# EAGLE design mbc_82_21_03_01 (EAGLE 7.6.0)

## Sheet 1 of 2
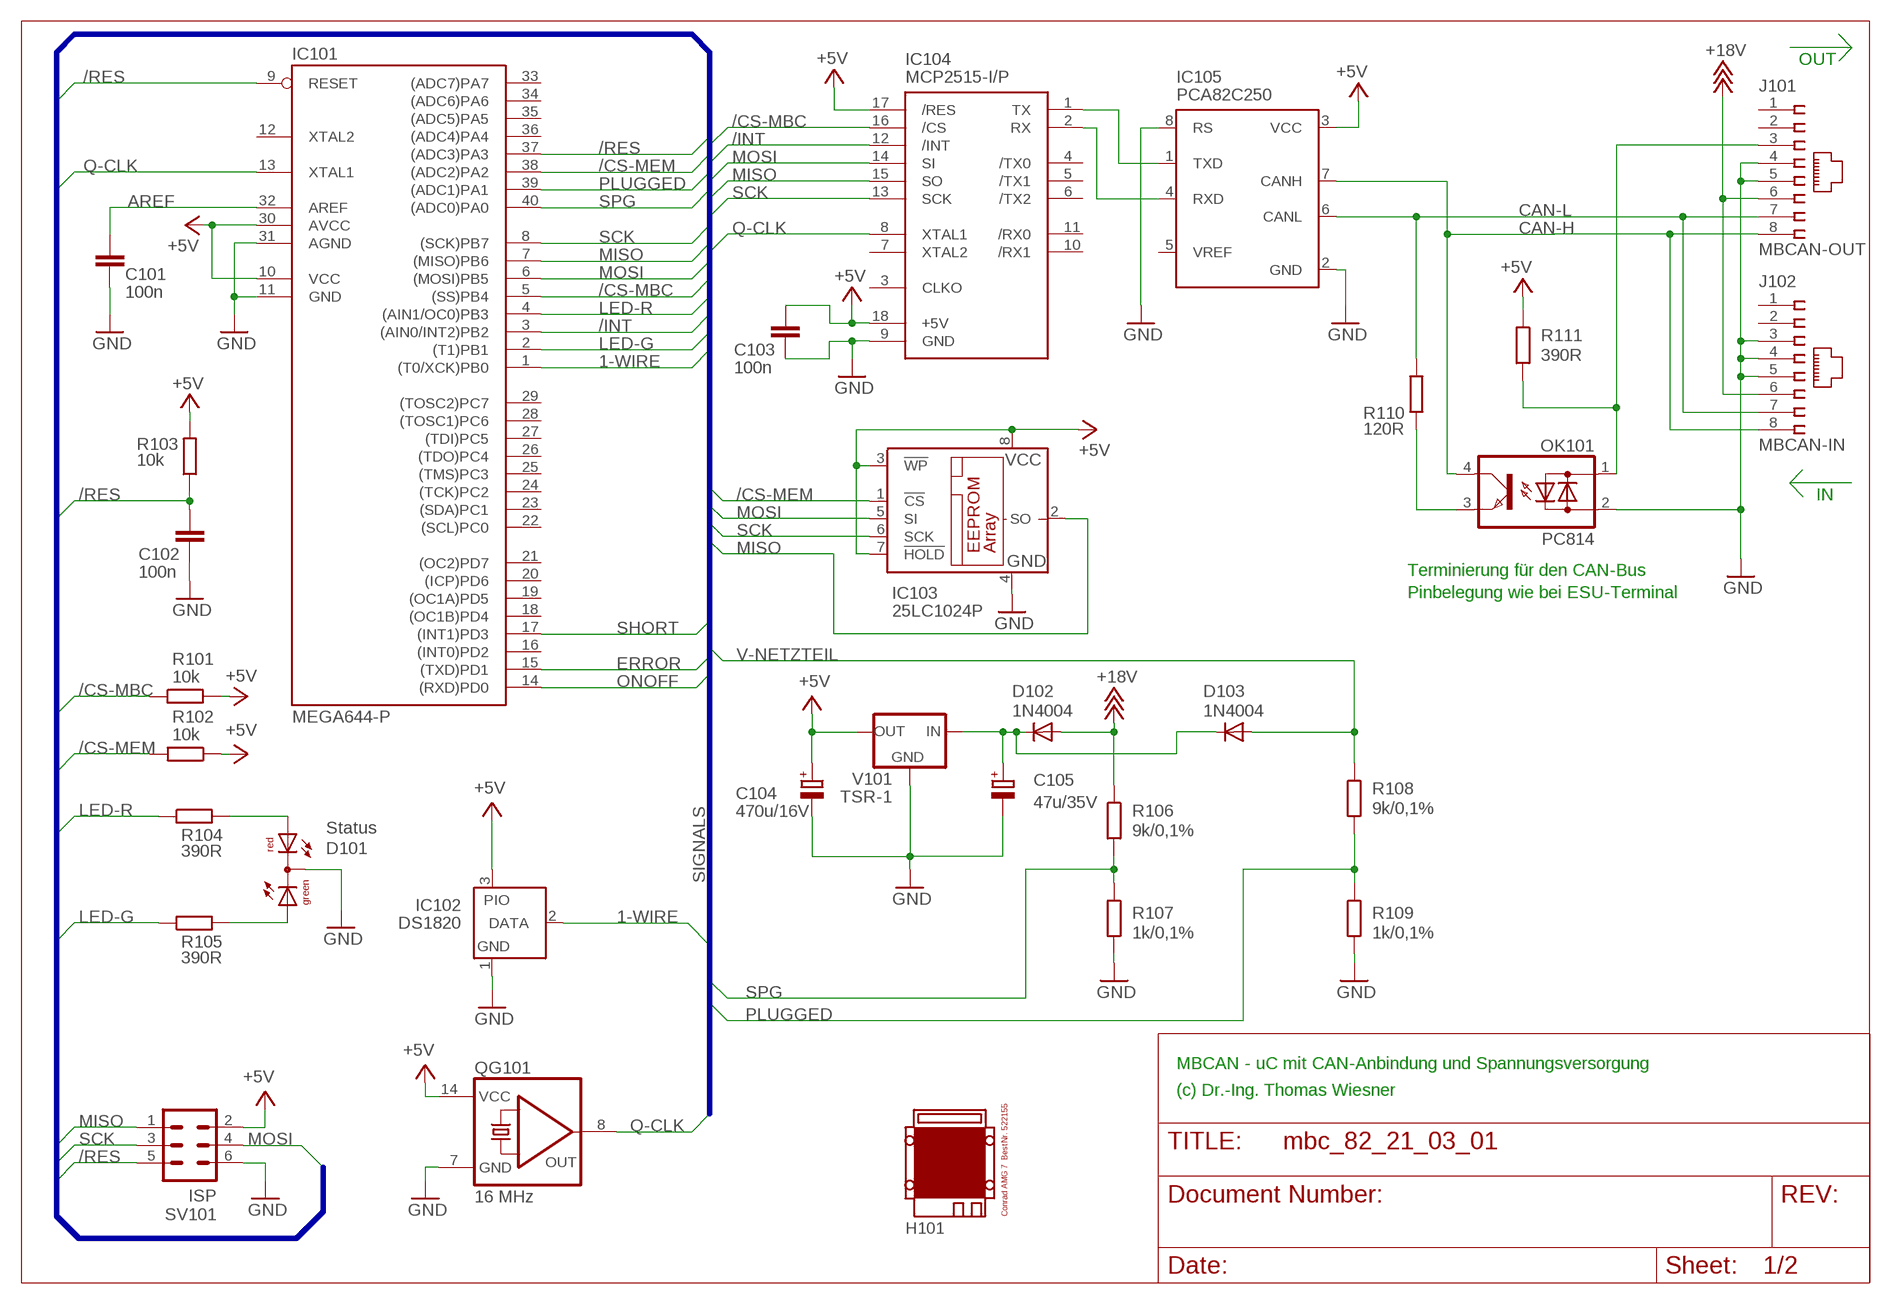
[diagram p0: schematic, sheet 1]

### Parts
C101  100n  C-EU025-025X050  [C025-025X050]
C102  100n  C-EU025-025X050  [C025-025X050]
C103  100n  C-EU025-025X050  [C025-025X050]
C104  470u/16V  CPOL-EUE3.5-8  [E3,5-8]
C105  47u/35V  CPOL-EUE2.5-7  [E2,5-7]
D101  Status  DUOLED5MM  [DUOLED5MM]
D102  1N4004  [DO41-10]
D103  1N4004  [DO41-10]
H101  MODULGEHÄUSE-AMG-7  [MODULGEHÄUSE-AMG-7]
IC101  MEGA644-P  MEGA323-P  [DIL40]
IC102  DS1820  DS2405  [TO92-]
IC103  25LC1024P  25LC040P  [DIL8]
IC104  MCP2515-I/P  MCP2510-I/P  [DIL18]
IC105  PCA82C250  [DIL08]
J101  MBCAN-OUT  215877-4  [215877-4]
J102  MBCAN-IN  215877-4  [215877-4]
OK101  PC814  [DIL04]
QG101  16 MHz  QG5860  [DIL14S]
R101  10k  R-EU_0207/10  [0207/10]
R102  10k  R-EU_0207/10  [0207/10]
R103  10k  R-EU_0207/10  [0207/10]
R104  390R  R-EU_0207/10  [0207/10]
R105  390R  R-EU_0207/10  [0207/10]
R106  9k/0,1%  R-EU_0207/10  [0207/10]
R107  1k/0,1%  R-EU_0207/10  [0207/10]
R108  9k/0,1%  R-EU_0207/10  [0207/10]
R109  1k/0,1%  R-EU_0207/10  [0207/10]
R110  120R  R-EU_0207/10  [0207/10]
R111  390R  R-EU_0207/10  [0207/10]
SV101  ISP  ML6  [ML6]
V101  TSR-1  [TRACO-TSR-1]

### Nets
1-WIRE: IC101.1((T0/XCK)PB0) IC102.2(DATA)
+5V: C103.1 C104.+ IC101.10(VCC) IC101.30(AVCC) IC102.3(PIO) IC103.3(!WP) IC103.7(!HOLD) IC103.8(VCC) IC104.17(/RES) IC104.18(+5V) IC105.3(VCC) QG101.14(VCC) R101.2 R102.1 R103.2 R111.1 SV101.2 V101.OUT ; also sheet 2
+18V: D102.A J101.6 J102.6 R106.1
/CS-MBC: IC101.5((SS)PB4) IC104.16(/CS) R101.1
/CS-MEM: IC101.38((ADC2)PA2) IC103.1(!CS) R102.2
/INT: IC101.3((AIN0/INT2)PB2) IC104.12(/INT)
/RES: C102.1 IC101.9(RESET) IC101.37((ADC3)PA3) R103.1 SV101.5
AREF: C101.1 IC101.32(AREF)
CAN-H: IC105.7(CANH) J101.8 J102.8 OK101.4(C)
CAN-L: IC105.6(CANL) J101.7 J102.7 R110.2
ERROR: IC101.15((TXD)PD1) ; also sheet 2
GND: C101.2 C102.2 C103.2 C104.- C105.- D101.K(C) IC101.11(GND) IC101.31(AGND) IC102.1(GND) IC103.4(GND) IC104.9(GND) IC105.2(GND) IC105.8(RS) J101.4 J101.5 J102.3 J102.4 J102.5 OK101.2(AC2) QG101.7(GND) R107.2 R109.2 SV101.6 V101.GND ; also sheet 2
LED-G: IC101.2((T1)PB1) R105.1
LED-R: IC101.4((AIN1/OC0)PB3) R104.1
MISO: IC101.7((MISO)PB6) IC103.2(SO) IC104.15(SO) SV101.1
MOSI: IC101.6((MOSI)PB5) IC103.5(SI) IC104.14(SI) SV101.4
N$1: IC104.1(TX) IC105.1(TXD)
N$2: IC104.2(RX) IC105.4(RXD)
N$3: OK101.3(E) R110.1
N$4: J101.3 OK101.1(AC1) R111.2
N$6: C105.+ D102.C D103.C V101.IN
N$9: D101.AR R104.2
N$13: D101.AG R105.2
ONOFF: IC101.14((RXD)PD0) ; also sheet 2
PLUGGED: IC101.39((ADC1)PA1) R108.2 R109.1
Q-CLK: IC101.13(XTAL1) IC104.8(XTAL1) QG101.8(OUT)
SCK: IC101.8((SCK)PB7) IC103.6(SCK) IC104.13(SCK) SV101.3
SHORT: IC101.17((INT1)PD3) ; also sheet 2
SPG: IC101.40((ADC0)PA0) R106.2 R107.1
V-NETZTEIL: D103.A R108.1 ; also sheet 2
Unconnected: IC101.12(XTAL2) IC101.16((INT0)PD2) IC101.18((OC1B)PD4) IC101.19((OC1A)PD5) IC101.20((ICP)PD6) IC101.21((OC2)PD7) IC101.22((SCL)PC0) IC101.23((SDA)PC1) IC101.24((TCK)PC2) IC101.25((TMS)PC3) IC101.26((TDO)PC4) IC101.27((TDI)PC5) IC101.28((TOSC1)PC6) IC101.29((TOSC2)PC7) IC101.33((ADC7)PA7) IC101.34((ADC6)PA6) IC101.35((ADC5)PA5) IC101.36((ADC4)PA4) IC104.3(CLKO) IC104.4(/TX0) IC104.5(/TX1) IC104.6(/TX2) IC104.7(XTAL2) IC104.10(/RX1) IC104.11(/RX0) IC105.5(VREF) J101.1 J101.2 J102.1 J102.2

### Buses
SIGNALS

### Notes on the sheet
- OUT
- IN
- Terminierung für den CAN-Bus
- Pinbelegung wie bei ESU-Terminal
- MBCAN - uC mit CAN-Anbindung und Spannungsversorgung
- (c) Dr.-Ing. Thomas Wiesner

## Sheet 2 of 2
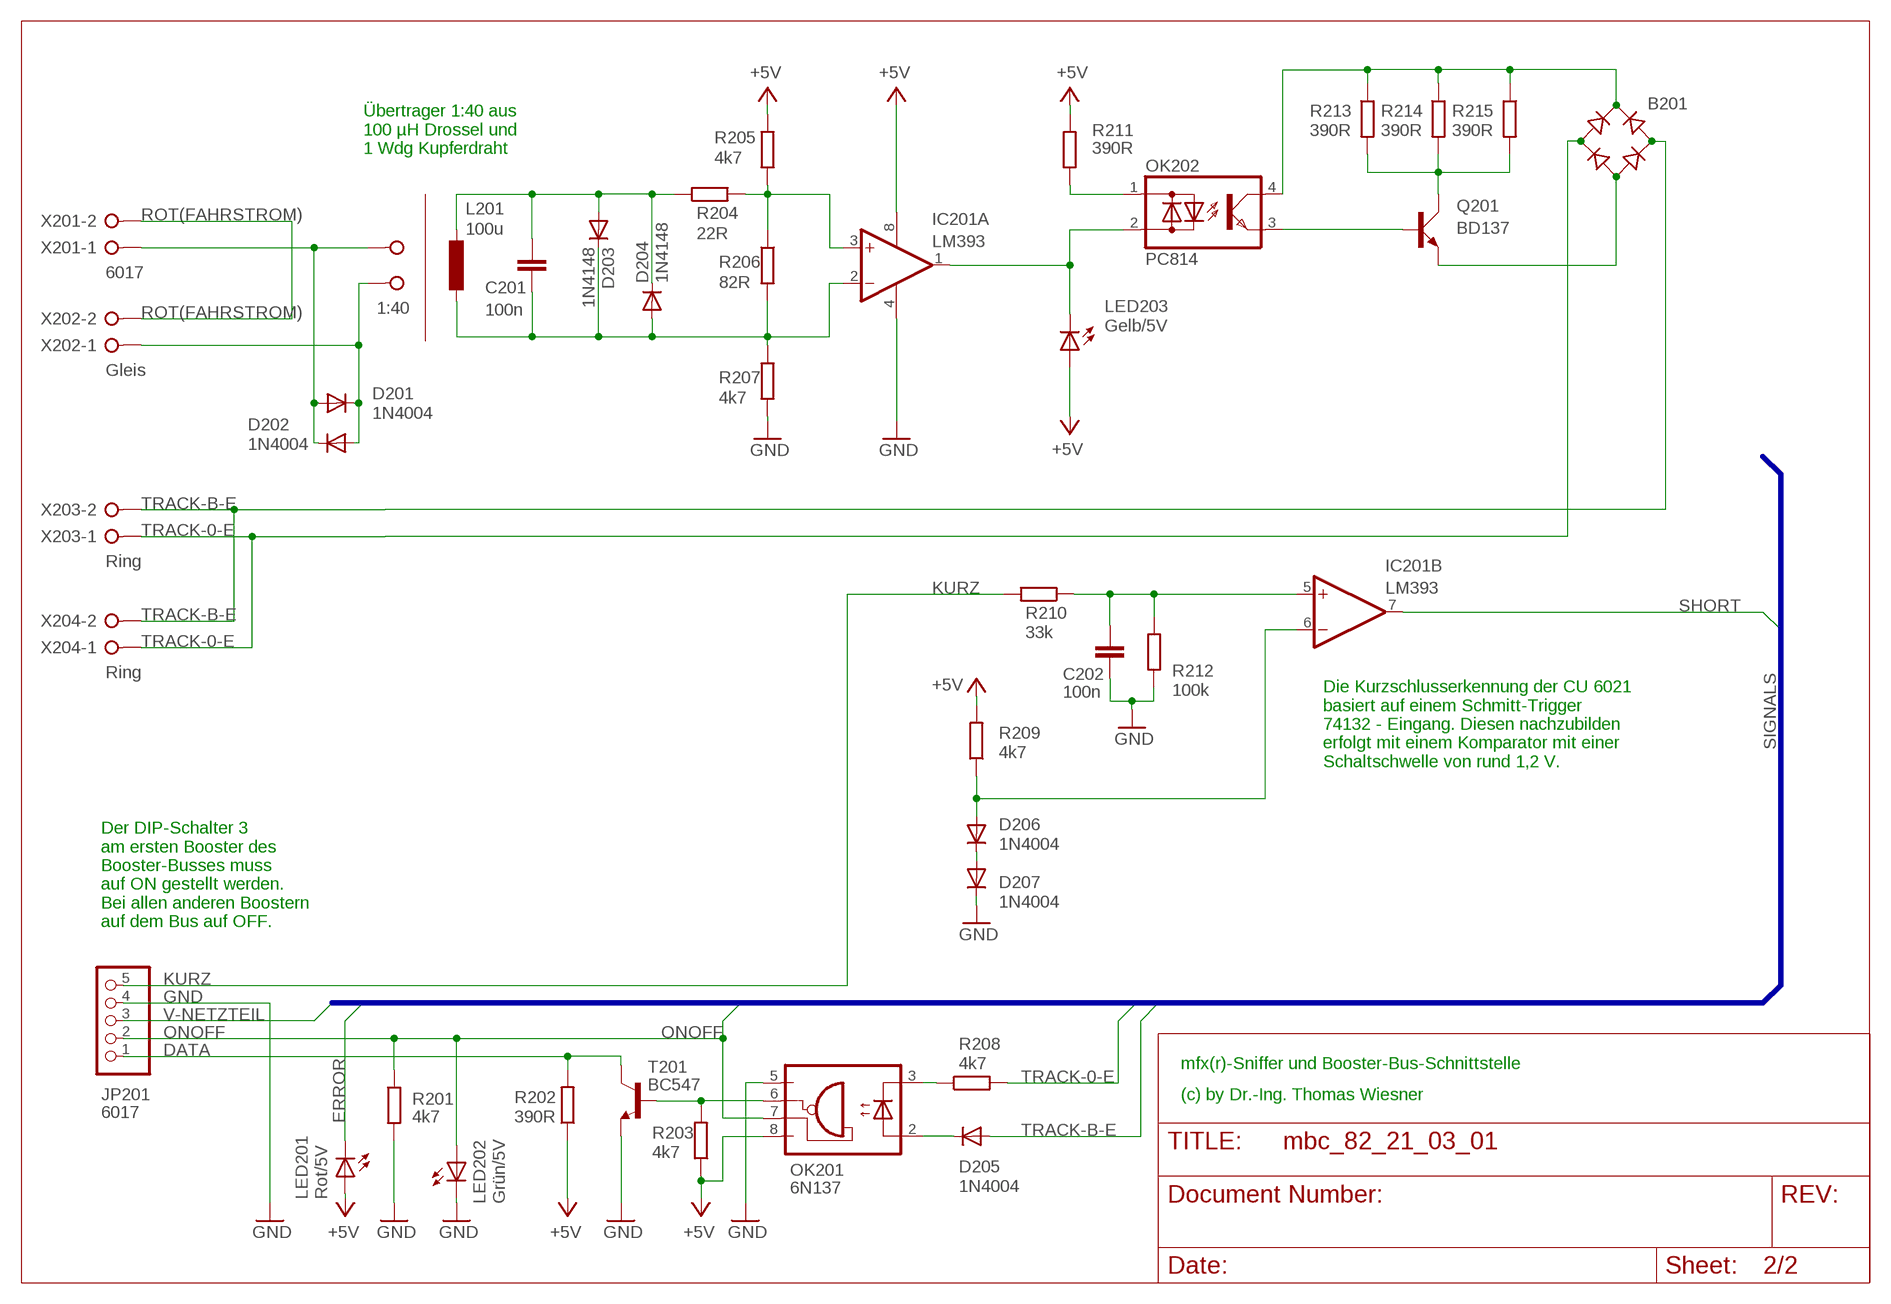
[diagram p1: schematic, sheet 2]

### Parts
B201  RB1A  [RB1A]
C201  100n  C-EU025-025X050  [C025-025X050]
C202  100n  C-EU025-025X050  [C025-025X050]
D201  1N4004  [DO41-10]
D202  1N4004  [DO41-10]
D203  1N4148  1N4148DO35-10  [DO35-10]
D204  1N4148  1N4148DO35-10  [DO35-10]
D205  1N4004  [DO41-10]
D206  1N4004  [DO41-10]
D207  1N4004  [DO41-10]
IC201  LM393  [DIL08]
JP201  6017  PINHD-1X5  [1X05]
L201  100u  L-EU6000-XXX-RC  [6000-XXXX-RC]
LED201  Rot/5V  LED3MM  [LED3MM]
LED202  Grün/5V  LED3MM  [LED3MM]
LED203  Gelb/5V  LED3MM  [LED3MM]
OK201  6N137  [DIL08]
OK202  PC814  [DIL04]
Q201  BD137  BD139  [TO126AV]
R201  4k7  R-EU_0207/10  [0207/10]
R202  390R  R-EU_0207/10  [0207/10]
R203  4k7  R-EU_0207/10  [0207/10]
R204  22R  R-EU_0207/10  [0207/10]
R205  4k7  R-EU_0207/10  [0207/10]
R206  82R  R-EU_0207/10  [0207/10]
R207  4k7  R-EU_0207/10  [0207/10]
R208  4k7  R-EU_0207/10  [0207/10]
R209  4k7  R-EU_0207/10  [0207/10]
R210  33k  R-EU_0207/10  [0207/10]
R211  390R  R-EU_0207/10  [0207/10]
R212  100k  R-EU_0207/10  [0207/10]
R213  390R  R-EU_0207/10  [0207/10]
R214  390R  R-EU_0207/10  [0207/10]
R215  390R  R-EU_0207/10  [0207/10]
T201  BC547  [TO92]
TP  1:40  W237-02P  [W237-132]
X201  6017  W237-02P  [W237-132]
X202  Gleis  W237-02P  [W237-132]
X203  Ring  W237-02P  [W237-132]
X204  Ring  W237-02P  [W237-132]

### Nets
+5V: IC201.8(A:V+) LED201.A LED203.A OK201.8(VCC) R202.1 R203.1 R205.2 R209.2 R211.2 ; also sheet 1
DATA: JP201.1 R202.2 T201.3(C)
ERROR: LED201.K(C) ; also sheet 1
GND: C202.2 D207.C IC201.4(A:V-) JP201.4 LED202.K(C) OK201.5(GND) R201.2 R207.2 R212.2 T201.1(E) ; also sheet 1
KURZ: JP201.5 R210.2
N$5: OK202.3(E) Q201.B
N$7: D205.C OK201.2(A)
N$8: OK201.3(C) R208.1
N$12: B201.- Q201.E
N$14: C201.2 D203.C D204.A IC201.2(A:-IN) L201.2 R206.2 R207.1
N$15: IC201.3(A:+IN) R204.2 R205.1 R206.1
N$16: D201.C D202.A TP.1 X202.1
N$17: B201.+ OK202.4(C) R213.1 R214.1 R215.1
N$18: Q201.C R213.2 R214.2 R215.2
N$19: C201.1 D203.A D204.C L201.1 R204.1
N$20: D206.C D207.A
N$21: OK202.1(AC1) R211.1
N$22: IC201.1(A:COLOUT) LED203.K(C) OK202.2(AC2)
N$23: D206.A IC201.6(B:-IN) R209.1
N$24: C202.1 IC201.5(B:+IN) R210.1 R212.1
N$29: OK201.6(VO) R203.2 T201.2(B)
O': D201.A D202.C TP.2 X201.1
ONOFF: JP201.2 LED202.A OK201.7(VE) R201.1 ; also sheet 1
ROT(FAHRSTROM): X201.2 X202.2
SHORT: IC201.7(B:COLOUT) ; also sheet 1
TRACK-0-E: B201.AC1 R208.2 X203.1 X204.1
TRACK-B-E: B201.AC2 D205.A X203.2 X204.2
V-NETZTEIL: JP201.3 ; also sheet 1

### Buses
SIGNALS

### Notes on the sheet
- Übertrager 1:40 aus
  100 µH Drossel und 
  1 Wdg Kupferdraht
- Die Kurzschlusserkennung der CU 6021
  basiert auf einem Schmitt-Trigger 
  74132 - Eingang. Diesen nachzubilden 
  erfolgt mit einem Komparator mit einer
  Schaltschwelle von rund 1,2 V.
- Der DIP-Schalter 3
  am ersten Booster des
  Booster-Busses muss
  auf ON gestellt werden.
  Bei allen anderen Boostern
  auf dem Bus auf OFF.
- mfx(r)-Sniffer und Booster-Bus-Schnittstelle
- (c) by Dr.-Ing. Thomas Wiesner

## Library data of the parts
B201 = rectifier:RB1A: RECTIFIER 1 A
C101-C103 C201 C202 = rcl:C-EU: CAPACITOR, European symbol
C104 C105 = rcl:CPOL-EU: POLARIZED CAPACITOR, European symbol
D101 = led:DUOLED5MM: DUO LED 2 colors, 5 mm, round
D102 D103 D201 D202 D205-D207 = diode:1N4004: DIODE general purpose rectifier, 1 A
D203 D204 = diode:1N4148: DIODE high speed (Philips)
H101 = mbc:MODULGEHÄUSE-AMG-7: Gehäuse Conrad AMG 7 BestNr. 522155
IC101 = atmel:MEGA323-P: MICROCONTROLLER 32 Kbytes FLASH 2 Kbytes SRAM 1 Kbytes EEPROM USART 8-channel 10 bit ADC Source: avr.lbr; OC_FARNELL: unknown; OC_NEWARK: unknown
IC102 = maxim:DS2405: Addressable Switch DALLAS Semiconductor; MF: DALLAS SEMICONDUCTOR; MPN: DS2405; OC_FARNELL: 1188025; OC_NEWARK: 06F4645
IC103 = microchip:25*: Serial EEPROM 4K/ 8K , SPI bus; MF: MICROCHIP; MPN: 25LC040/P; OC_FARNELL: 9758100; OC_NEWARK: 96K4091
IC104 = mbc:MCP2510: BASIC-CAN 2.0a Controller Stand-alone CAN controller von Microchip
IC105 = micro-philips:PCA82C250: CAN CONTROLLER INTERFACE; OC_FARNELL: 3692358; OC_NEWARK: unknown
IC201 = mbc:LM393: DC-Comparator Dual
J101 J102 = con-amp:215877-4: AMP connector
JP201 = pinhead:PINHD-1X5: PIN HEADER
L201 = rcl:L-EU: INDUCTOR, European symbol
LED201-LED203 = led:LED: LED OSRAM: - CHIPLED LG R971, LG N971, LY N971, LG Q971, LY Q971, LO R971, LY R971 LH N974, LH R974 LS Q976, LO Q976, LY Q976 LO Q996 - Hyper CHIPLED LW Q18S LB Q993, LB Q99A, LB R99A - SideLED LS A670, LO A670, LY A670, LG A670, LP A670 LB A673, LV A673, LT A673, LW A673 LH A674 LY A675 LS A676, LA A676, LO A676, LY A676, LW A676 LS A679, LY A679, LG A679 - Hyper Micro SIDELED® LS Y876, LA Y876, LO Y876, LY Y876 LT Y87S - SmartLED LW L88C, LW L88S LB L89C, LB L89S, LG L890 LS L89K, LO L89K, LY L89K LS L896, LA L896, LO L896, LY L896 - TOPLED LS T670, LO T670, LY T670, LG T670, LP T670 LSG T670, LSP T670, LSY T670, LOP T670, LYG T670 LG T671, LOG T671, LSG T671 LB T673, LV T673, LT T673, LW T673 LH T674 LS T676, LA T676, LO T676, LY T676, LB T676, LH T676, LSB T676, LW T676 LB T67C, LV T67C, LT T67C, LS T67K, LO T67K, LY T67K, LW E67C LS E67B, LA E67B, LO E67B, LY E67B, LB E67C, LV E67C, LT E67C LW T67C LS T679, LY T679, LG T679 LS T770, LO T770, LY T770, LG T770, LP T770 LB T773, LV T773, LT T773, LW T773 LH T774 LS E675, LA E675, LY E675, LS T675 LS T776, LA T776, LO T776, LY T776, LB T776 LHGB T686 LT T68C, LB T68C - Hyper Mini TOPLED® LB M676 - Mini TOPLED Santana® LG M470 LS M47K, LO M47K, LY M47K Source: http://www.osram.convergy.de LUXEON: - LUMILED® LXK2-PW12-R00, LXK2-PW12-S00, LXK2-PW14-U00, LXK2-PW14-V00 LXK2-PM12-R00, LXK2-PM12-S00, LXK2-PM14-U00 LXK2-PE12-Q00, LXK2-PE12-R00, LXK2-PE12-S00, LXK2-PE14-T00, LXK2-PE14-U00 LXK2-PB12-K00, LXK2-PB12-L00, LXK2-PB12-M00, LXK2-PB14-N00, LXK2-PB14-P00, LXK2-PB14-Q00 LXK2-PR12-L00, LXK2-PR12-M00, LXK2-PR14-Q00, LXK2-PR14-R00 LXK2-PD12-Q00, LXK2-PD12-R00, LXK2-PD12-S00 LXK2-PH12-R00, LXK2-PH12-S00 LXK2-PL12-P00, LXK2-PL12-Q00, LXK2-PL12-R00 Source: www.luxeon.com KINGBRIGHT: KA-3528ASYC Source: www.kingbright.com
OK101 OK202 = optocoupler:PC814: SHARP OPTO COUPLER; OC_FARNELL: 9707662; OC_NEWARK: unknown
OK201 = optocoupler:6N137: MOTOROLA OPTO COUPLER; MPN: 6N137; OC_FARNELL: 1328376; OC_NEWARK: 52M1895
Q201 = transistor-power:BD139: NPN TRANSISTOR
QG101 = crystal:QG5860: CRYSTAL RESONATOR; OC_FARNELL: unknown; OC_NEWARK: unknown
R101-R111 R201-R215 = resistor:R-EU_: RESISTOR, European symbol
SV101 = con-ml:ML6: HARTING; OC_FARNELL: unknown; OC_NEWARK: unknown
T201 = transistor:BC547: NPN TRANSISTOR
TP X201-X204 = con-wago-508:W237-02P: WAGO SREW CLAMP; OC_FARNELL: unknown; OC_NEWARK: unknown
V101 = mbc:TSR-1: Spannungsregler Hersteller: TRACO Typ: TSR-1 5V: TSR 1-2450 Spg: 5V Strom: 1A Reichelt TSR 1-2450

## Board
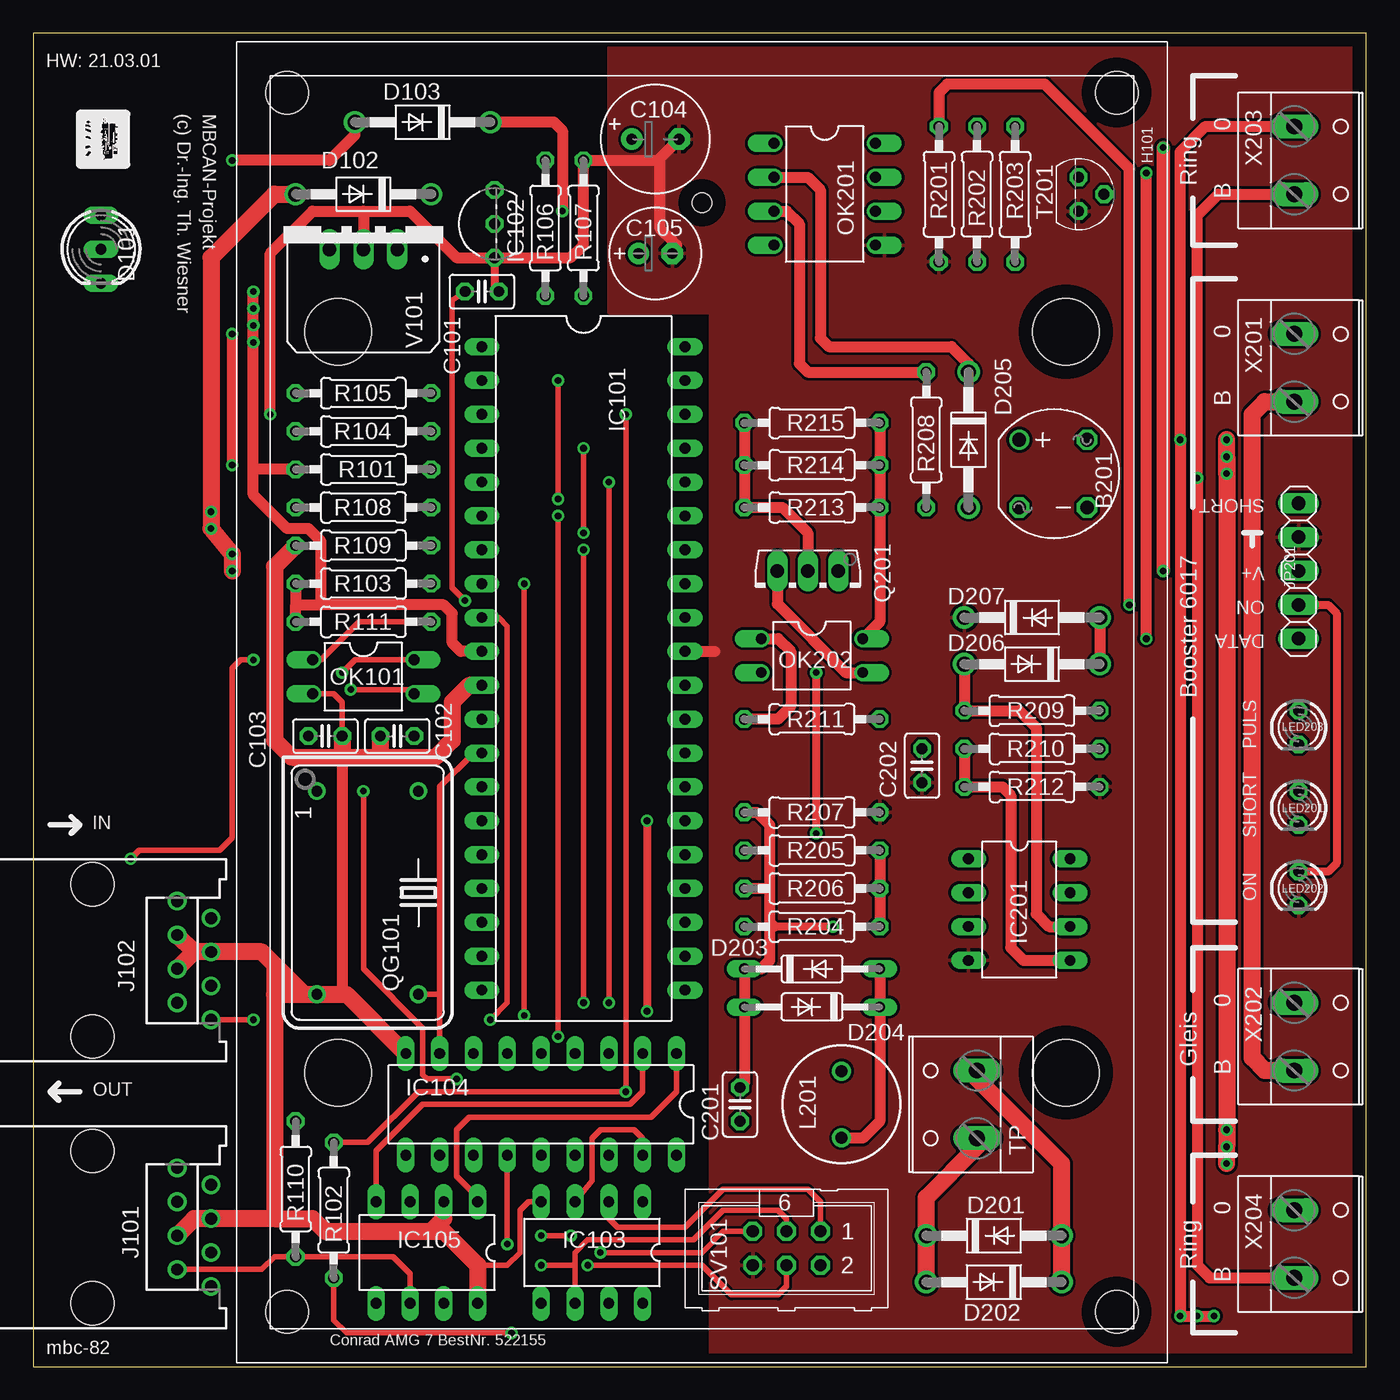
[diagram p2: board, top side]
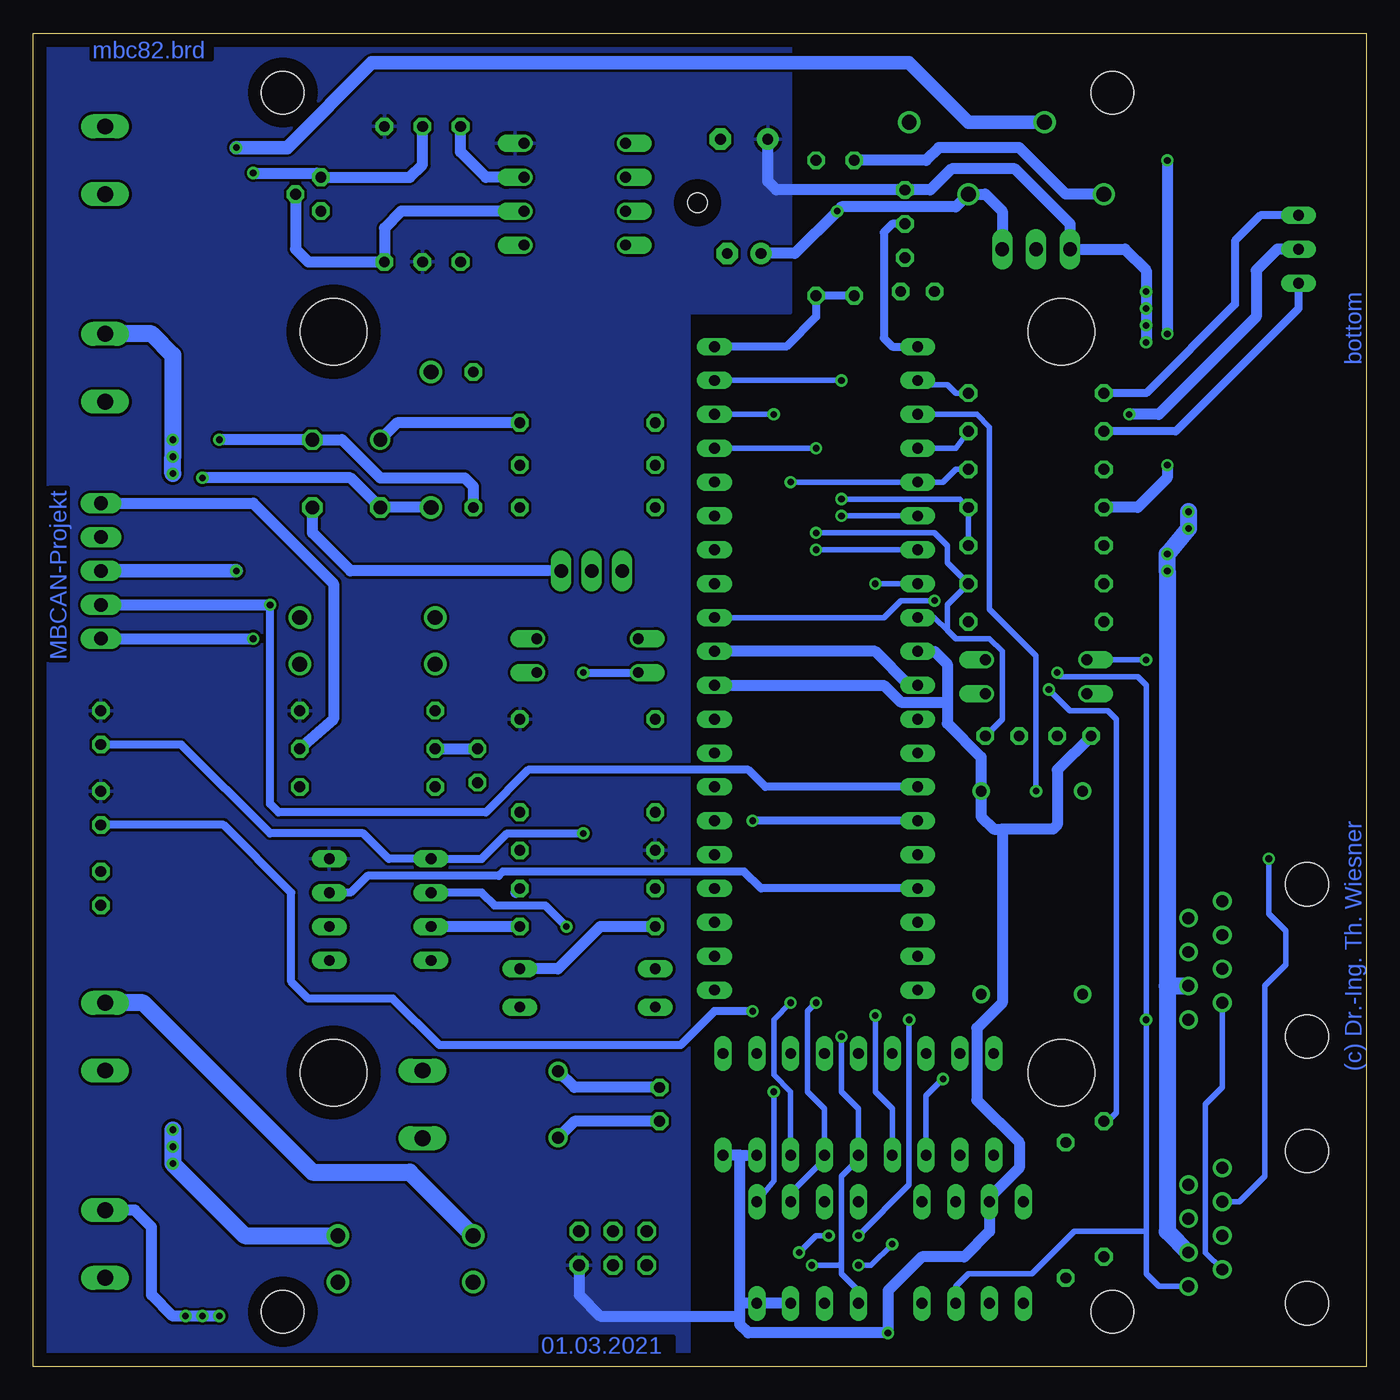
[diagram p3: board, bottom side, seen from below]

Size 100 x 99.99 mm. Coordinates in mm from the lower left corner, seen from the top.
Outline: 0,99.99 0,0 100,0 100,99.99 0,99.99
Copper layers (1*16): Top 0.035mm / dielectric 1.5mm / Bottom 0.035mm
Design rules "default *": minimum track width 10mil, minimum drill 0.5mm, track to track 8mil, track to pad 8mil, pad to pad 8mil, via to via 8mil, smd to smd 8mil, copper to edge 40mil, drill to drill 8mil, minimum pad ring 10mil, minimum via ring 8mil, stop-mask expansion 4mil, vias tented up to drill 0mil, thermal gap 10mil

### Footprints (pad centres in the part's own frame; a part is rotated, then mirrored left to right if it is on the bottom)
RB1A = drill 1.016: + -2.54,2.54 | drill 1.016 octagon: - 2.54,-2.54; AC1 2.54,2.54; AC2 -2.54,-2.54
C025-025X050 = drill 0.813 octagon: 1 -1.27,0; 2 1.27,0
E3,5-8 = drill 0.813 pad 1.6: + -1.778,0 | drill 0.813 pad 1.6 octagon: - 1.778,0
E2,5-7 = drill 0.813 pad 1.6: + -1.27,0 | drill 0.813 pad 1.6 octagon: - 1.27,0
DUOLED5MM = drill 0.813 long: AG -2.54,0; AR 2.54,0; K 0,0
DO41-10 = drill 1.118: A 5.08,0; C -5.08,0
DO35-10 = drill 0.813 long: A 5.08,0; C -5.08,0
MODULGEHÄUSE-AMG-7 = hole 3.2: -45.72,-31.115; -45.72,31.115; 45.72,31.115; 45.72,-31.115 | hole 5: -27.781,-27.305; 27.781,-27.305; -27.781,27.305; 27.781,27.305 | hole 1.5: -37.465,0
DIL40 = drill 0.813 long: 1 -24.13,-7.62; 2 -21.59,-7.62; 3 -19.05,-7.62; 4 -16.51,-7.62; 5 -13.97,-7.62; 6 -11.43,-7.62; 7 -8.89,-7.62; 8 -6.35,-7.62; 9 -3.81,-7.62; 10 -1.27,-7.62; 11 1.27,-7.62; 12 3.81,-7.62; 13 6.35,-7.62; 14 8.89,-7.62; 15 11.43,-7.62; 16 13.97,-7.62; 17 16.51,-7.62; 18 19.05,-7.62; 19 21.59,-7.62; 20 24.13,-7.62; 21 24.13,7.62; 22 21.59,7.62; 23 19.05,7.62; 24 16.51,7.62; 25 13.97,7.62; 26 11.43,7.62; 27 8.89,7.62; 28 6.35,7.62; 29 3.81,7.62; 30 1.27,7.62; 31 -1.27,7.62; 32 -3.81,7.62; 33 -6.35,7.62; 34 -8.89,7.62; 35 -11.43,7.62; 36 -13.97,7.62; 37 -16.51,7.62; 38 -19.05,7.62; 39 -21.59,7.62; 40 -24.13,7.62
TO92- = drill 0.813 octagon: 1 -2.54,0; 2 0,0; 3 2.54,0
DIL8 = drill 0.813 long: 1 -3.81,-3.81; 2 -1.27,-3.81; 3 1.27,-3.81; 4 3.81,-3.81; 5 3.81,3.81; 6 1.27,3.81; 7 -1.27,3.81; 8 -3.81,3.81
DIL18 = drill 0.813 long: 1 -10.16,-3.81; 2 -7.62,-3.81; 3 -5.08,-3.81; 4 -2.54,-3.81 | drill 0.8 long: 5 0,-3.81; 6 2.54,-3.81; 7 5.08,-3.81; 8 7.62,-3.81; 9 10.16,-3.81; 10 10.16,3.81; 11 7.62,3.81; 12 5.08,3.81; 13 2.54,3.81; 14 0,3.81; 15 -2.54,3.81; 16 -5.08,3.81; 17 -7.62,3.81; 18 -10.16,3.81
DIL08 = drill 0.813 long: 1 -3.81,-3.81; 2 -1.27,-3.81; 3 1.27,-3.81; 4 3.81,-3.81; 5 3.81,3.81; 6 1.27,3.81; 7 -1.27,3.81; 8 -3.81,3.81
215877-4 = drill 0.889: 1 -4.445,6.35; 2 -3.175,8.89; 3 -1.905,6.35; 4 -0.635,8.89; 5 0.635,6.35; 6 1.905,8.89; 7 3.175,6.35; 8 4.445,8.89 | hole 3.251: -5.715,0; 5.715,0
1X05 = drill 1.016 long: 1 -5.08,0; 2 -2.54,0; 3 0,0; 4 2.54,0; 5 5.08,0
6000-XXXX-RC = drill 0.9 pad 1.422: 1 -2.5,0; 2 2.5,0
LED3MM = drill 0.813 octagon: A -1.27,0; K 1.27,0
DIL04 = drill 0.813 offset: 1 -1.27,-3.81; 2 1.27,-3.81; 3 1.27,3.81; 4 -1.27,3.81
DIL08' = drill 0.813 offset: 1 -3.81,-3.81; 2 -1.27,-3.81; 3 1.27,-3.81; 4 3.81,-3.81; 5 3.81,3.81; 6 1.27,3.81; 7 -1.27,3.81; 8 -3.81,3.81
TO126AV = drill 1.016 long: B 2.286,-1.27; C 0,-1.27; E -2.286,-1.27
DIL14S = drill 0.813: 1 -7.62,-3.81; 7 7.62,-3.81; 8 7.62,3.81; 14 -7.62,3.81
0207/10 = drill 0.813 octagon: 1 -5.08,0; 2 5.08,0
ML6 = drill 0.914 octagon: 1 -2.54,-1.27; 2 -2.54,1.27; 3 0,-1.27; 4 0,1.27; 5 2.54,-1.27; 6 2.54,1.27
TO92 = drill 0.813 octagon: 1 1.27,0; 2 0,1.905; 3 -1.27,0
W237-132 = drill 1.194 long: 1 -2.54,-0.635; 2 2.54,-0.635
TRACO-TSR-1 = drill 1.016 long: GND 0,2.54; IN -2.54,2.54; OUT 2.54,2.54

### Placement (x,y rotation side)
B201  76.52,66.97 0 top
C101  33.66,80.62 0 top
C102  27.3,47.29 180 top
C103  21.91,47.29 0 top
C104  46.67,92.06 0 top
C105  46.67,83.48 0 top
C201  53.02,19.66 90 top
C202  66.67,45.06 270 top
D101  5.08,83.8 270 top
D102  24.77,87.93 180 top
D103  29.21,93.33 180 top
D201  72.07,9.82 0 top
D202  72.07,6.33 180 top
D203  58.42,29.82 0 top
D204  58.42,26.97 180 top
D205  70.17,69.51 270 top
D206  74.93,52.68 180 top
D207  74.93,56.18 0 top
H101  50.16,49.83 270 top
IC101  41.27,52.37 270 top
IC102  34.61,85.7 90 top
IC103  41.91,8.55 180 top
IC104  38.1,19.66 180 top
IC105  29.53,8.55 180 top
IC201  73.98,34.27 270 top
J101  4.45,10.46 270 top
J102  4.45,30.46 270 top
JP201  94.93,59.67 90 top
L201  60.64,19.66 90 top
LED201  94.93,41.89 270 top
LED202  94.93,35.86 270 top
LED203  94.93,47.92 270 top
OK101  24.77,51.73 270 top
OK201  6N137  [DIL08']  59.37,87.93 270 top
OK202  58.42,53.32 270 top
Q201  58.1,58.4 180 top
QG101  25.08,35.54 270 top
R101  24.77,67.29 180 top
R102  22.54,11.73 90 top
R103  24.77,58.72 180 top
R104  24.77,70.15 180 top
R105  24.77,73.01 180 top
R106  38.42,85.39 270 top
R107  41.27,85.39 90 top
R108  24.77,64.43 0 top
R109  24.77,61.57 180 top
R110  19.68,13.32 270 top
R111  24.77,55.86 0 top
R201  67.94,87.93 270 top
R202  70.8,87.93 90 top
R203  73.66,87.93 270 top
R204  58.42,33 0 top
R205  58.42,38.71 180 top
R206  58.42,35.86 180 top
R207  58.42,41.57 0 top
R208  66.99,69.51 270 top
R209  74.93,49.19 0 top
R210  74.93,46.33 0 top
R211  58.42,48.56 0 top
R212  74.93,43.48 0 top
R213  58.42,64.43 180 top
R214  58.42,67.61 180 top
R215  58.42,70.78 180 top
SV101  56.52,8.87 180 top
T201  78.42,87.93 270 top
TP  70.17,19.66 90 top
V101  24.77,86.34 180 top
X201  95.25,74.91 270 top
X202  95.25,24.75 270 top
X203  95.25,90.47 270 top
X204  95.25,9.19 270 top

### Tracks (layer width: path | path; a pad name or v marks a point on that pad's centre or on a via)
1-WIRE
  Bottom 0.61: IC102.2 35.56,85.7 36.2,85.07 36.2,77.13 35.56,76.5 IC101.1
+5V  (via drill 0.5)
  Top 0.406: R102.1 22.54,3.47 23.5,2.52 v35.88,2.52 | IC103.3 41.91,13.95 41.91,17.12 42.55,17.76 45.09,17.76 45.72,17.12 IC104.17
  Top 0.813: IC101.10 32.07,53.64 31.43,54.27 31.43,56.49 30.8,57.13 21.59,57.13 | 21.59,57.13 21.59,61.89 20.64,62.84 19.05,62.84 16.51,65.39 16.51,67.29 | 16.51,67.29 v16.51,76.81 v16.51,78.09 v16.51,79.36 v16.51,80.62 | R103.2 19.68,57.13 | R111.1 19.68,57.13 | 19.68,57.13 21.59,57.13 | R101.2 16.51,67.29
  Bottom 0.406: C104.+ 44.9,89.83
  Bottom 0.813: v16.51,76.81 v16.51,78.09 v16.51,79.36 v16.51,80.62 16.51,82.21 18.1,83.8 V101.OUT 22.23,85.7 26.35,89.83 31.11,89.83 32.7,88.25 IC102.3 44.26,88.25 44.9,88.88 C104.+ | 46.99,15.86 IC104.18 | 46.99,15.86 IC104.17 | 46.99,4.74 46.99,15.86 | 46.99,3.79 46.99,3.15 46.35,2.52 v35.88,2.52 35.88,5.7 33.34,8.24 30.16,8.24 28.26,10.14 IC105.3 28.26,12.68 26.04,14.9 26.04,16.81 29.21,19.98 29.21,25.38 27.3,27.29 27.3,40.3 | 46.99,3.79 46.99,4.74 | IC101.10 32.38,53.64 31.43,52.68 31.43,49.83 | 27.3,40.3 27.94,40.3 28.89,41.25 QG101.14 28.89,45.7 31.43,48.24 31.43,49.83 | C103.1 23.18,44.75 23.18,40.62 23.5,40.3 27.3,40.3 | IC103.7 IC103.8 46.99,4.74 | IC101.30 36.2,51.1 34.92,49.83 31.43,49.83 | SV101.2 59.05,5.38 57.47,3.79 46.99,3.79
  pour Bottom: 43.18,99.67 43.18,79.04 50.8,79.04 50.8,0.3 99.69,0.3 99.69,99.67
+18V  (via drill 0.5)
  Top 1.27: D102.A 18.1,87.93 13.34,83.17 v13.34,62.84 v14.92,60.94 v14.92,59.67
  Bottom 0.813: R106.1 33.02,90.47 32.07,91.42 26.04,91.42 22.54,87.93 D102.A
  Bottom 1.27: 14.92,28.55 v14.92,59.67 v14.92,60.94 v13.34,62.84 v13.34,64.12 | 14.92,28.55 J102.6 | 14.92,28.55 14.92,10.14 J101.6
/CS-MBC  (via drill 0.5)
  Top 0.406: v43.18,66.34 v43.18,27.29
  Bottom 0.406: v43.18,66.34 IC101.5 31.75,66.34 30.8,67.29 R101.1 | v43.18,27.29 44.45,26.02 44.45,21.89 43.18,20.62 IC104.16
/CS-MEM  (via drill 0.5)
  Top 0.406: v44.45,71.42 v44.45,20.62 28.89,20.62 25.08,16.81 R102.2
  Bottom 0.406: v44.45,20.62 44.45,13.95 IC103.1 | v44.45,71.42 IC101.38
/INT  (via drill 0.5)
  Top 0.406: v31.75,21.57 29.53,21.57 29.21,21.89 29.21,25.38 24.77,29.82 v24.77,43.16
  Bottom 0.406: IC104.12 33.02,20.3 v31.75,21.57 | v24.77,43.16 24.77,53.32 28.26,56.81 28.26,70.47 29.21,71.42 IC101.3
/RES  (via drill 0.5)
  Top 0.406: v34.29,26.02 35.56,27.29 35.56,55.54 34.92,56.18 IC101.9 | v41.27,68.88 v41.27,62.53 | v38.1,9.82 v40.32,9.82 | v42.55,8.55 50.16,8.55 51.75,10.14 SV101.5
  Bottom 0.406: v38.1,9.82 34.29,13.63 v34.29,26.02 | IC101.9 32.38,56.18 31.43,55.22 | C102.1 27.3,48.56 27.3,53.64 28.26,54.59 30.8,54.59 31.43,55.22 | 31.43,55.22 31.43,57.13 R103.1 31.43,60.3 31.43,61.57 32.38,62.53 v41.27,62.53 | IC101.37 v41.27,68.88 | v40.32,9.82 41.27,9.82 v42.55,8.55
AREF  (via drill 0.5)
  Top 0.406: v32.38,57.45 31.43,58.4 31.43,79.99 C101.1
  Bottom 0.406: IC101.32 36.2,56.18 34.92,57.45 v32.38,57.45
CAN-H  (via drill 0.5)
  Top 0.406: v16.51,26.02 J102.8 | OK101.4 24.13,53 v23.18,52.05
  Bottom 0.406: 16.51,10.14 v16.51,26.02 16.51,51.1 17.14,51.73 22.86,51.73 v23.18,52.05 | J101.8 15.56,6.01 16.51,6.97 16.51,10.14 | IC105.7 30.8,6.01 29.84,6.97 25.08,6.97 21.91,10.14 16.51,10.14
CAN-L
  Top 0.406: J101.7 17.14,7.28 18.1,8.24 R110.2 26.99,8.24 28.26,6.97 IC105.6
  Bottom 0.406: J101.7 12.06,8.55 12.06,19.66 10.79,20.93 J102.7
DATA  (via drill 0.5)
  Top 0.813: v83.5,54.59 v83.5,89.52
  Bottom 0.813: R202.2 70.8,90.15 71.75,89.2 T201.3 78.74,89.52 v83.5,89.52 | JP201.1 v83.5,54.59
ERROR  (via drill 0.5)
  Top 0.61: v46.04,40.94 v46.04,26.65
  Bottom 0.61: IC101.15 v46.04,40.94 | v46.04,26.65 48.9,26.65 51.44,24.11 69.53,24.11 73.03,27.6 79.38,27.6 80.64,28.87 80.64,35.54 85.72,40.62 LED201.K
GND  (via drill 0.5)
  Top 0.406: 33.34,7.6 35.56,7.6 36.51,8.55 36.51,11.73 37.15,12.36 IC103.4 | C104.- 48.45,91.93 46.99,90.47 | R109.2 19.68,61.73 | OK101.2 22.54,50.46 23.18,49.83 C103.2
  Top 0.61: IC102.1 34.61,80.94 C101.2
  Top 0.813: 23.18,45.7 23.18,27.92 | C104.- 46.86,90.47 R107.2 41.27,84.12 40.32,83.17 IC102.1 31.75,83.17 28.26,86.66 24.77,86.66 | 24.77,86.66 V101.GND | v17.78,71.42 17.78,83.48 20.95,86.66 24.77,86.66 | 46.99,90.47 46.99,85.39 47.94,84.44 | 47.94,84.44 C105.- | 48.26,84.12 47.94,84.44 | IC101.31 51.12,53.64
  Top 1.27: 23.18,45.7 19.37,45.7 18.1,46.97 18.1,59.99 R109.2 | 20.32,27.92 18.1,30.14 | 18.1,30.14 17.14,31.09 J102.4 12.06,31.09 | 12.06,31.09 J102.3 | 18.1,30.14 18.1,27.92 | 18.1,27.92 18.1,11.09 | 18.1,11.09 J101.4 12.06,11.09 J101.5 | 18.1,27.92 20.32,27.92 | 20.32,27.92 QG101.7 23.18,27.92 23.5,27.92 IC104.9 | IC105.8 33.34,7.6 30.8,10.14 29.84,10.14 | 29.84,10.14 30.8,11.09 IC105.2 | 29.84,10.14 21.91,10.14 20.95,11.09 18.1,11.09 | 23.18,45.7 26.04,45.7 | 26.04,45.7 30.16,45.7 31.43,46.97 31.43,49.83 32.7,51.1 IC101.11 | 12.06,31.09 J102.5 | C102.2 26.04,45.7 | C103.2 23.18,45.7
  Bottom 0.813: IC101.11 34.29,51.1 36.83,53.64 IC101.31 | D101.K 6.67,83.8 8.26,82.21 8.26,78.72 15.56,71.42 v17.78,71.42
  pour Top: 99.69,99.67 43.18,99.67 43.18,79.04 50.8,79.04 50.8,0.3 99.69,0.3
KURZ
  Bottom 0.813: JP201.5 83.5,64.75 77.47,58.72 77.47,48.56 R210.2
LED-G
  Bottom 0.406: R105.1 30.8,73.01 31.43,73.64 32.7,73.64 33.02,73.96 IC101.2
LED-R
  Bottom 0.406: IC101.4 30.8,68.88 R104.1
MISO  (via drill 0.5)
  Top 0.406: v41.27,61.26 v41.27,27.29 | SV101.1 59.05,12.36 58.1,13.32 51.75,13.32 48.9,10.46 43.81,10.46 43.18,11.09 IC103.2
  Bottom 0.406: IC101.7 v41.27,61.26 | v41.27,27.29 41.91,26.65 41.91,20.62 40.64,19.35 IC104.15 40.64,15.54 43.18,13 IC103.2
MOSI  (via drill 0.5)
  Top 0.406: v39.37,63.8 v39.37,24.75 | SV101.4 56.52,6.01 55.88,5.38 52.39,5.38 50.16,7.6 v41.59,7.6
  Bottom 0.406: IC101.6 v39.37,63.8 | v39.37,24.75 39.37,20.62 38.1,19.35 IC104.14 38.1,15.54 39.37,14.27 39.37,7.85 | v41.59,7.6 39.44,7.6 39.37,7.85 | IC103.5 38.1,5.7 39.37,6.97 39.37,7.85
N$1
  Top 0.406: IC105.1 33.02,13 31.75,14.27 31.75,17.76 32.7,18.71 46.35,18.71 48.26,20.62 IC104.1
N$2
  Top 0.406: IC104.2 45.72,20.62 44.77,19.66 29.21,19.66 25.72,16.17 IC105.4
N$3  (via drill 0.5)
  Top 0.406: v23.81,50.78 28.26,50.78 OK101.3
  Bottom 0.406: R110.1 19.37,18.39 18.73,19.03 18.73,48.56 19.37,49.19 22.23,49.19 v23.81,50.78
N$4  (via drill 0.5)
  Top 0.406: R111.2 24.45,55.86 21.59,53 OK101.1 | v16.51,53 15.56,53 14.92,52.37 14.92,39.67 13.97,38.71 7.94,38.71 v7.3,38.08
  Bottom 0.406: OK101.1 v16.51,53 | v7.3,38.08 7.3,33.95 6.03,32.68 6.03,30.14 7.62,28.55 7.62,14.27 9.53,12.36 J101.3
N$5
  Top 0.813: Q201.B 55.82,57.19 60.96,52.05 OK202.3
N$6  (via drill 0.5)
  Top 0.813: v39.69,86.66 39.69,92.69 39.05,93.33 D103.C
  Bottom 0.813: C105.+ 42.86,83.48 v39.69,86.66 39.37,86.98 30.8,86.98 D102.C 28.57,87.93 27.3,86.66 V101.IN
N$7
  Top 0.813: OK201.2 58.1,89.2 59.05,88.25 59.05,77.13 59.69,76.5 68.9,76.5 70.17,75.23 D205.C
N$8
  Top 0.813: OK201.3 56.52,86.66 57.47,85.7 57.47,75.23 58.1,74.59 R208.1
N$9
  Bottom 0.61: R104.2 14.29,70.15 5.08,79.36 D101.AR
N$12
  Bottom 0.813: Q201.E 76.2,59.67 79.06,62.53 B201.-
N$13
  Bottom 0.61: R105.2 16.51,73.01 9.84,79.67 9.84,84.44 7.94,86.34 D101.AG
N$14  (via drill 0.5)
  Top 0.61: v60.01,33 55.56,33
  Top 0.813: C201.2 53.34,21.25 D204.A D203.C 54.61,29.82 55.24,30.46 55.24,33.32 | R207.1 54.29,41.57 55.24,40.62 55.24,35.86 | R206.2 55.24,35.86 | 55.24,35.86 55.24,33.32 | 55.56,33 55.24,33.32
  Bottom 0.61: v60.01,33 61.59,34.59 65.41,34.59 66.36,35.54 IC201.2
  Bottom 0.813: C201.2 59.41,20.93 L201.2
N$15
  Top 0.813: R205.1 R206.1 R204.2
  Bottom 0.813: R206.1 63.82,35.54 | R204.2 IC201.3
N$16
  Top 1.27: D202.A D201.C 66.99,12.68 70.8,16.49 TP.1
  Bottom 1.27: D201.C 71.75,14.59 79.06,14.59 91.76,27.29 X202.1
N$17
  Top 0.813: R215.1 R214.1 R213.1 63.5,55.86 OK202.4
  Bottom 0.813: R215.1 72.71,70.78 B201.+
N$18
  Top 0.813: R215.2 R214.2 R213.2 56.2,64.43 58.1,62.53 Q201.C
N$19
  Top 0.813: D203.A D204.C 63.5,18.39 62.23,17.12 60.68,17.12 L201.1
  Bottom 0.813: C201.1 59.41,18.39 L201.1 | R204.1 57.47,33 60.64,29.82 D203.A
N$20
  Top 0.813: D207.A D206.C
N$21
  Top 0.813: OK202.1 55.88,54.59 56.83,53.64 56.83,49.51 55.88,48.56 R211.1
N$22  (via drill 0.5)
  Top 0.61: v58.74,39.98 v58.74,52.05
  Bottom 0.61: v58.74,39.98 64.45,39.98 66.36,38.08 IC201.1 73.34,38.08 75.25,39.98 82.23,39.98 88.9,46.65 LED203.K | v58.74,52.05 OK202.2
N$23
  Top 0.813: D206.A R209.1 73.98,49.19 75.25,47.92 75.25,33.95 76.2,33 IC201.6
N$24
  Top 0.813: R210.1 R212.1 72.71,43.48 73.34,42.84 73.34,31.41 74.3,30.46 IC201.5
  Bottom 0.813: R210.1 C202.1
N$29
  Bottom 0.813: OK201.6 72.39,86.66 73.66,85.39 R203.2 79.38,82.85 80.33,83.8 T201.2
O'  (via drill 0.5)
  Top 1.27: D202.C D201.A 77.15,15.22 70.8,21.57 TP.2 | v89.53,66.97 v89.53,68.24 | v89.53,68.24 v89.53,17.76 v89.53,16.49 v89.53,15.22 | v89.53,68.24 v89.53,69.51
  Bottom 1.27: v89.53,17.76 v89.53,15.22 | v89.53,16.49 v89.53,15.22 | v89.53,15.22 84.14,9.82 D201.A | v89.53,66.97 v89.53,68.24 v89.53,69.51 89.53,75.86 91.12,77.45 X201.1
ONOFF  (via drill 0.5)
  Top 0.61: JP201.2 97.16,57.13 97.79,56.49 97.79,37.76 97.16,37.13 LED202.A
  Top 0.813: v82.23,57.13 82.23,89.83 75.88,96.18 68.58,96.18 67.94,95.55 R201.1
  Bottom 0.61: IC101.14 45.09,43.48 46.35,44.75 62.87,44.75 66.04,41.57 81.6,41.57 82.23,42.21 v82.23,57.13
  Bottom 0.813: OK201.7 66.04,89.2 67.94,91.1 R201.1 | JP201.2 v82.23,57.13
PLUGGED  (via drill 0.5)
  Top 0.406: v39.37,73.96 v39.37,65.07
  Bottom 0.406: R109.1 R108.2 30.48,65.07 v39.37,65.07 | IC101.39 v39.37,73.96
Q-CLK
  Top 0.406: IC101.13 33.02,46.02 30.48,43.48 30.48,27.92 | 30.48,27.92 IC104.8 | 30.48,27.92 QG101.8
ROT(FAHRSTROM)
  Top 1.27: X202.2 92.39,22.21 91.44,23.16 91.44,71.42 92.39,72.37 X201.2
SCK  (via drill 0.5)
  Top 0.406: v36.83,58.72 v36.83,26.33 | IC103.6 40.64,7.6 | IC104.13 v35.56,9.19 | v38.1,7.6 40.64,7.6 | 40.64,7.6 40.64,8.55 41.59,9.51 49.53,9.51 51.75,11.73 55.88,11.73 56.52,11.09 SV101.3
  Bottom 0.406: IC101.8 v36.83,58.72 | v36.83,26.33 36.83,20.62 35.56,19.35 IC104.13 | v35.56,9.19 37.15,7.6 v38.1,7.6
SHORT
  Bottom 0.61: IC101.17 45.4,35.86 46.67,37.13 64.77,37.13 65.09,36.81 74.93,36.81 76.2,35.54 IC201.7
SPG
  Bottom 0.61: R106.2 R107.1 41.27,78.72 43.5,76.5 IC101.40
TRACK-0-E  (via drill 0.5)
  Top 0.813: X203.1 87.95,93.01 86.04,91.1 v86.04,69.51 v86.04,3.79 v87.31,3.79 v88.58,3.79
  Bottom 0.813: v86.04,69.51 B201.AC1 76.83,69.51 73.98,66.66 67.63,66.66 66.99,66.02 R208.2 | v86.04,3.79 v87.31,3.79 v88.58,3.79 89.53,3.79 91.12,5.38 91.12,10.46 92.39,11.73 X204.1
TRACK-B-E  (via drill 0.5)
  Top 0.813: X203.2 88.9,87.93 87.31,86.34 v87.31,66.66 87.31,7.6 88.27,6.65 X204.2
  Bottom 0.813: v87.31,66.66 76.2,66.66 B201.AC2 D205.A
V-NETZTEIL  (via drill 0.5)
  Top 0.813: v14.92,90.47 22.23,90.47 24.13,92.37 D103.A | v14.92,77.45 v14.92,67.61
  Top 1.016: v84.77,91.42 v84.77,59.67
  Bottom 0.813: v14.92,90.47 v14.92,77.45 | v14.92,67.61 14.92,66.66 17.14,64.43 R108.1
  Bottom 1.016: v84.77,91.42 80.96,91.42 74.61,97.77 34.29,97.77 29.84,93.33 D103.A | v84.77,59.67 JP201.3

### Text on the board
Bottom: mbc82.brd | bottom | MBCAN-Projekt | (c) Dr.-Ing. Th. Wiesner | 01.03.2021
tNames: HW: 21.03.01 | (c) Dr.-Ing. Th. Wiesner | MBCAN-Projekt | 0 | Ring | B | 0 | B | SHORT | V+ | ON | DATA | Booster 6017 | PULS | IN | SHORT | ON | 0 | Gleis | B | OUT | 0 | Ring | B | mbc-82